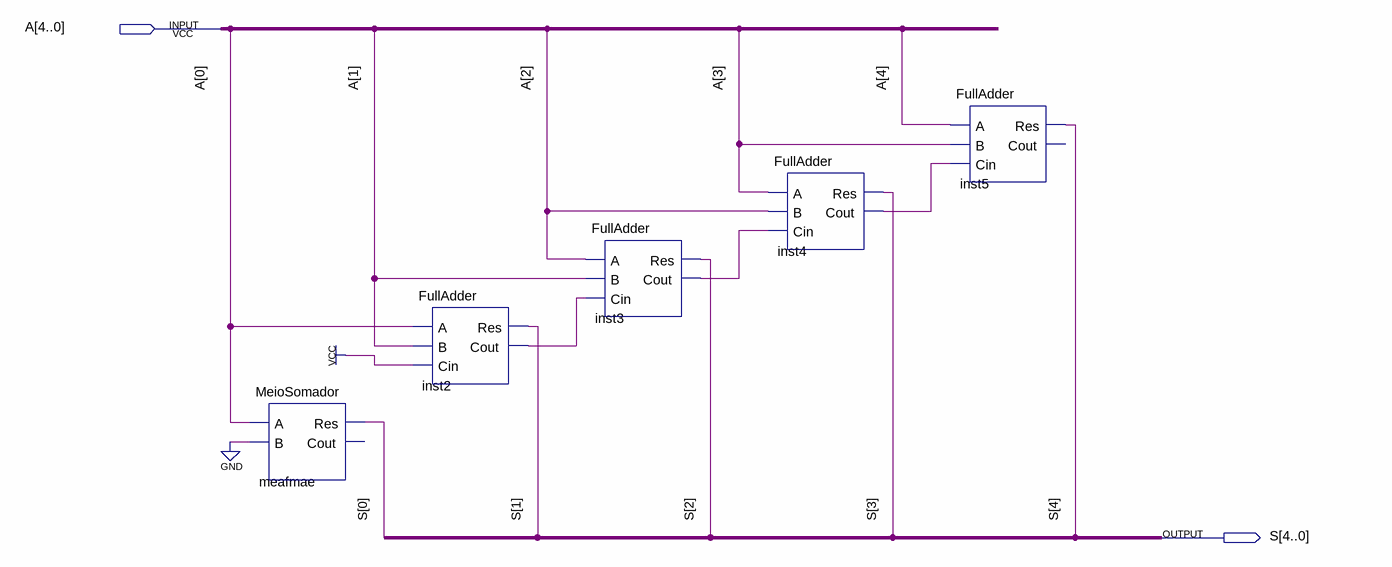
[diagram p0: schematic sheet]
// Quartus schematic Mult3_2.bdf as structural Verilog: 5 symbols, 2 pins
module Mult3_2 (
  input  [4:0] A,
  output [4:0] S
);

  wire inst2_cout, inst3_cout, inst4_cout;

  MeioSomador meafmae (.A(A[0]), .B(1'b0), .Res(S[0]));  // open: Cout
  FullAdder inst2 (.A(A[0]), .B(A[1]), .Cin(1'b1), .Res(S[1]), .Cout(inst2_cout));
  FullAdder inst3 (.A(A[2]), .B(A[1]), .Cin(inst2_cout), .Res(S[2]), .Cout(inst3_cout));
  FullAdder inst4 (.A(A[3]), .B(A[2]), .Cin(inst3_cout), .Res(S[3]), .Cout(inst4_cout));
  FullAdder inst5 (.A(A[4]), .B(A[3]), .Cin(inst4_cout), .Res(S[4]));  // open: Cout
endmodule
